# Altium schematic sheet signal-light-17.SchDoc
size A4; SheetNumber: 20; SheetTotal: 21
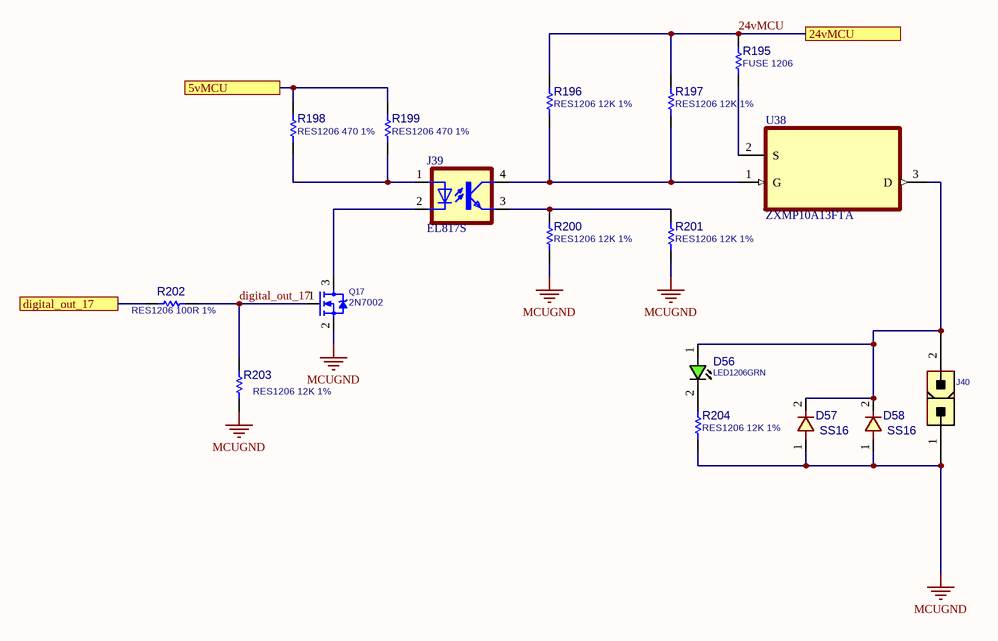
[diagram p0: signal-light-17.SchDoc]

## Parts
D56  LED1206GRN  [LED1206GRN]
D57  SS16  [D_SMA]
D58  SS16  [D_SMA]
J39  EL817S  [SOIC254P1030X460-4N]
J40  CONN_ATXPWR_2  [ATXPWR_2]  (value not drawn)
Q17  2N7002  [SOT23_3]
R195  FUSE 1206  [R1206]
R196  RES1206 12K 1%  [R1206]
R197  RES1206 12K 1%  [R1206]
R198  RES1206 470 1%  [R1206]
R199  RES1206 470 1%  [R1206]
R200  RES1206 12K 1%  [R1206]
R201  RES1206 12K 1%  [R1206]
R202  RES1206 100R 1%  [R1206]
R203  RES1206 12K 1%  [R1206]
R204  RES1206 12K 1%  [R1206]
U38  ZXMP10A13FTA  [SOT95P230X110-3N]

## Ports
5vMCU, 24vMCU, digital_out_17

## Nets
MCUGND: D57.1 D58.1 J40.1 Q17.2(SOURCE) R200.2 R201.2 R203.2 R204.2
5vMCU: R198.2 R199.2 ; port 5vMCU
24vMCU: R195.1 R196.1 R197.1 ; port 24vMCU
digital_out_17: Q17.1(GATE) R202.2 R203.1
digital_out_17: R202.1 ; port digital_out_17  [a separate net that carries the same name]
NetD56_1: D56.1(ANODE) D57.2 D58.2 J40.2 U38.3(D)
NetD56_2: D56.2(CATHODE) R204.1
NetJ39_1: J39.1(A) R198.1 R199.1
NetJ39_2: J39.2(C) Q17.3(DRAIN)
NetJ39_3: J39.3(EMIT) R200.1 R201.1
NetJ39_4: J39.4(COL) R196.2 R197.2 U38.1(G)
NetR195_2: R195.2 U38.2(S)

## Library data of the parts
D56 = LED_SMD_1206_GRN: LED, SMD, 1206, GREEN; PARAM: 20mA; DESC: DESCRIPTION; PARAM2: 2.2V; MANF: -; ASSEMBLY: ASSEMBLY; PRICE: 36t@Javan; MANF_P#: -; VALUE: LED1206GRN; MountType: SMT; PartType: LED
D57 D58 = DIODE_SMD_1N4001: DIODE, GENERAL PURPOSE, 50V/1A; DESC: DESCRIPTION; PARAM: 50V VRRM; PARAM2: 1A; MANF_P#: 1N4001; MANF: MANF; ASSEMBLY: ASSEMBLY; PRICE: PRICE; VALUE: SS16
J39 = EL817S: Optoisolator Transistor Output 5000Vrms 1 Channel 4-SMD; MF: Everlight Electronics; SnapEDA_Link: https://www.snapeda.com/parts/EL817S/Everlight+Electronics+Co+Ltd/view-part/?ref=snap; Package: SMD-4 Everlight Electronics Co Ltd; Value: *; MP: EL817S; Check_prices: https://www.snapeda.com/parts/EL817S/Everlight+Electronics+Co+Ltd/view-part/?ref=eda
J40 = CONN_ATXPWR_2: CONN, ATX POWER, 2 P; MANF: Molex; MANF_P#: 39281023; VALUE: CONN_ATXPWR_2; MountType: THD; PACKAGE: ATXPWR-2pin; Part Type: Conn.
Q17 = MOSN_2N7002_SOT23: MOSFET, N-CH, 60V, 0.3A; MANF: NXP; ASSEMBLY: ASSEMBLY; MANF_P#: 2N7002; PARAM2: 60v; PARAM: 0.3A; PRICE: 0.3t@Javan; VALUE: 2N7002
R195-R204 = RES_SMD_1206: RESISTOR, SMD; PARAM: 1%, 0.25W; DESC: DESCRIPTION; DIST#: MOUSER; MANF_P#: -; MANF: -; ASSEMBLY: ASSEMBLY; PRICE: -; PARAM2: -
U38 = ZXMP10A13FTA: P-Channel 100 V 600mA (Ta) 625mW (Ta) Surface Mount SOT-23-3; MF: Diodes Inc.; Purchase-URL: https://pricing.snapeda.com/search/part/ZXMP10A13FTA/?ref=eda; Package: SOT-23-3 Diodes Inc.; SnapEDA_Link: https://www.snapeda.com/parts/ZXMP10A13FTA/Diodes+Inc./view-part/?ref=snap; Availability: In Stock; Value: *; MP: ZXMP10A13FTA; Check_prices: https://www.snapeda.com/parts/ZXMP10A13FTA/Diodes+Inc./view-part/?ref=eda; Price: None